# Altium project Mini-Stylophone.PrjPcb
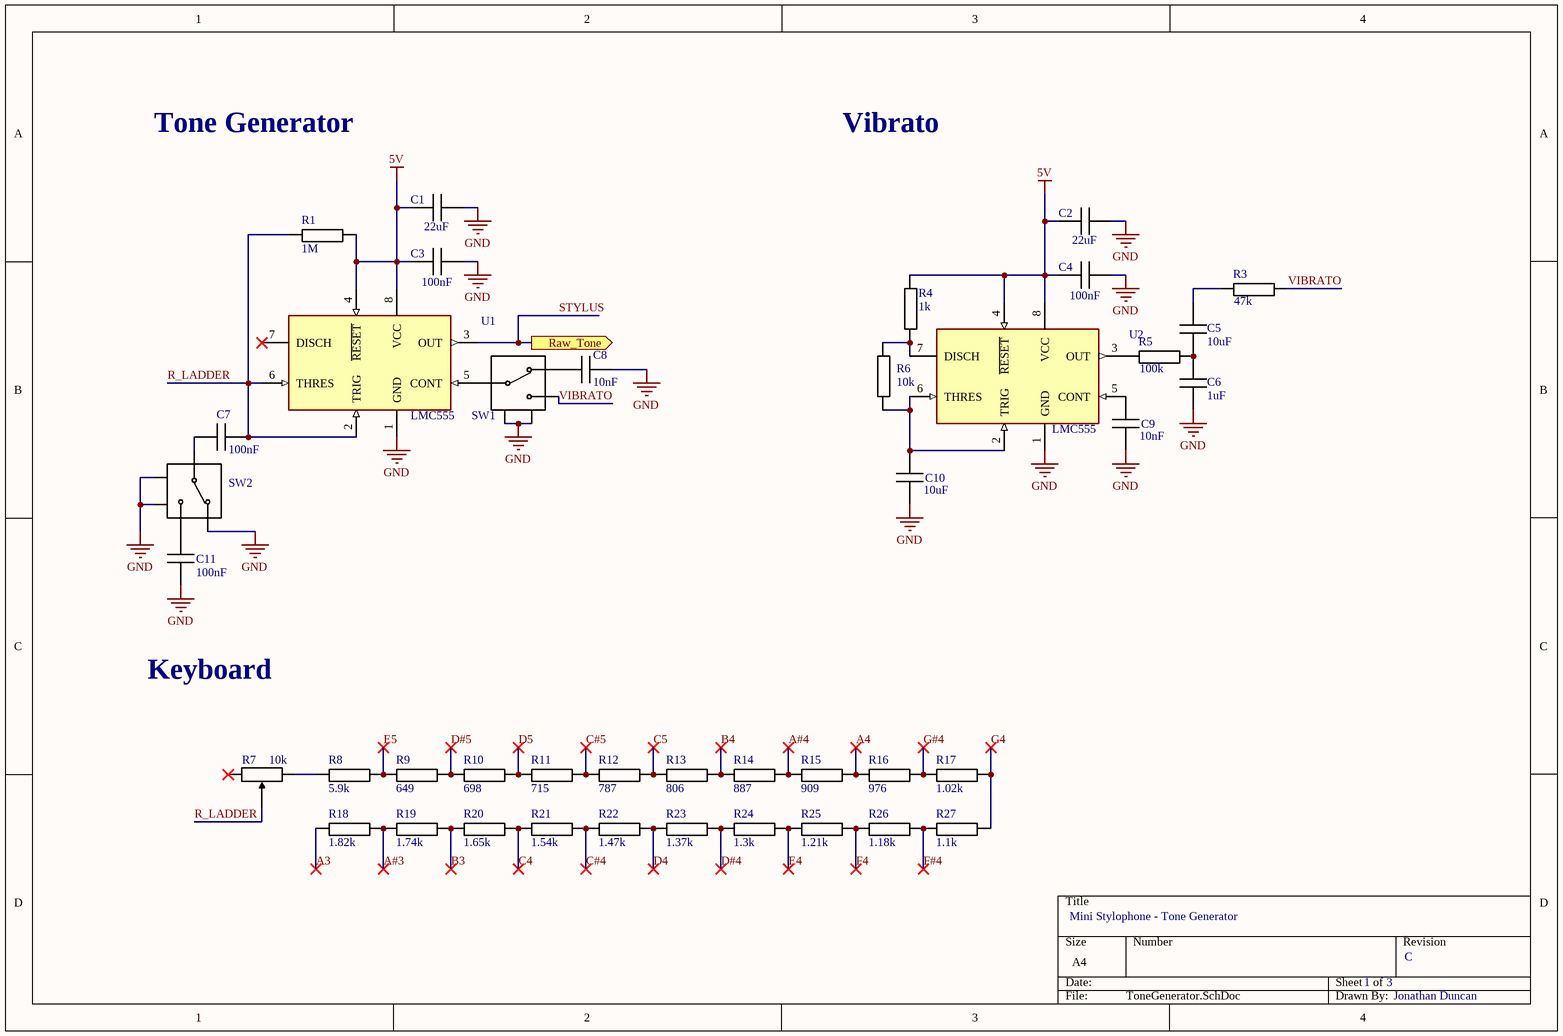
[diagram p0: ToneGenerator.SchDoc]
3 sheets, 82 parts. Net scope: flat (ports and power ports of the same name join across sheets).
Board file: StylophonePCB.PcbDoc
Sheets:
  ToneGenerator.SchDoc
  Amplifier.SchDoc
  Power.SchDoc

## Sheet ToneGenerator.SchDoc
size A4; SheetNumber: 1; SheetTotal: 2

### Parts
C1  value 22uF  [FP-CC0603-DA-IPC_B]  (hidden comment: Cap 22uF 0603)
C2  value 22uF  [FP-CC0603-DA-IPC_B]  (hidden comment: Cap 22uF 0603)
C3  value 100nF  [FP-CC0603-DA-IPC_B]  (hidden comment: Cap 100nF 0603)
C4  value 100nF  [FP-CC0603-DA-IPC_B]  (hidden comment: Cap 100nF 0603)
C5  value 10uF  [FP-CC0603-DA-IPC_B]  (hidden comment: Cap 10uF 0603)
C6  value 1uF  [FP-CC0603-DA-IPC_B]  (hidden comment: Cap 1uF 0603)
C7  value 100nF  [FP-CC0603-DA-IPC_B]  (hidden comment: Cap 100nF 0603)
C8  value 10nF  [FP-CC0603-DA-IPC_B]  (hidden comment: Cap 10nF 0603)
C9  value 10nF  [FP-CC0603-DA-IPC_B]  (hidden comment: Cap 10nF 0603)
C10  value 10uF  [FP-CC0603-DA-IPC_B]  (hidden comment: Cap 10uF 0603)
C11  value 100nF  [FP-CC0603-DA-IPC_B]  (hidden comment: Cap 100nF 0603)
R1  value 1M  [FP-RC0603-0_55-IPC_B]  (hidden comment: Res 1M 0603)
R3  value 47k  [FP-RC0603-0_55-IPC_B]  (hidden comment: Res 47k 0603)
R4  value 1k  [FP-RC0603-0_55-IPC_B]  (hidden comment: Res 1k 0603)
R5  value 100k  [FP-RC0603-0_55-IPC_B]  (hidden comment: Res 100k 0603)
R6  value 10k  [FP-RC0603-0_55-IPC_B]  (hidden comment: Res 10k 0603)
R7  value 10k  [BOUR-TC33X-2_V]  (hidden comment: TC33X-2-103E)
R8  value 5.9k  [FP-RC0603-0_55-IPC_B]  (hidden comment: Res 5k1 0603)
R9  value 649  [FP-RC0603-0_55-IPC_B]  (hidden comment: Res 620R 0603)
R10  value 698  [FP-RC0603-0_55-IPC_B]  (hidden comment: Res 680R 0603)
R11  value 715  [FP-RC0603-0_55-IPC_B]  (hidden comment: Res 750R 0603)
R12  value 787  [FP-RC0603-0_55-IPC_B]  (hidden comment: Res 750R 0603)
R13  value 806  [FP-RC0603-0_55-IPC_B]  (hidden comment: Res 820R 0603)
R14  value 887  [FP-RC0603-0_55-IPC_B]  (hidden comment: Res 910R 0603)
R15  value 909  [FP-RC0603-0_55-IPC_B]  (hidden comment: Res 910R 0603)
R16  value 976  [FP-RC0603-0_55-IPC_B]  (hidden comment: Res 1k 0603)
R17  value 1.02k  [FP-RC0603-0_55-IPC_B]  (hidden comment: Res 1k 0603)
R18  value 1.82k  [FP-RC0603-0_55-IPC_B]  (hidden comment: Res 1k8 0603)
R19  value 1.74k  [FP-RC0603-0_55-IPC_B]  (hidden comment: Res 1k8 0603)
R20  value 1.65k  [FP-RC0603-0_55-IPC_B]  (hidden comment: Res 1k6 0603)
R21  value 1.54k  [FP-RC0603-0_55-IPC_B]  (hidden comment: Res 1k5 0603)
R22  value 1.47k  [FP-RC0603-0_55-IPC_B]  (hidden comment: Res 1k5 0603)
R23  value 1.37k  [FP-RC0603-0_55-IPC_B]  (hidden comment: Res 1k3 0603)
R24  value 1.3k  [FP-RC0603-0_55-IPC_B]  (hidden comment: Res 1k3 0603)
R25  value 1.21k  [FP-RC0603-0_55-IPC_B]  (hidden comment: Res 1k3 0603)
R26  value 1.18k  [FP-RC0603-0_55-IPC_B]  (hidden comment: Res 1k1 0603)
R27  value 1.1k  [FP-RC0603-0_55-IPC_B]  (hidden comment: Res 1k1 0603)
SW1  SS12D07VG4 087  [SS12D07VG4 087-Footprint-1]  (value not drawn)
SW2  SS12D07VG4 087  [SS12D07VG4 087-Footprint-1]  (value not drawn)
U1  LMC555  [FP-D0008A-IPC_B]
U2  LMC555  [FP-D0008A-IPC_B]

### Ports
Raw_Tone (out, see Amplifier[1B])

### Nets
5V: C1.1 C2.1 C3.1 C4.1 R1.2 R4.2 U1.4(~{RESET}) U1.8(VCC) U2.4(~{RESET}) U2.8(VCC)
GND: C1.2 C2.2 C3.2 C4.2 C6.1 C8.1 C9.1 C10.1 C11.2 SW1.4 SW1.5 SW2.1 SW2.4 SW2.5 U1.1(GND) U2.1(GND)
A3: R18.1
A4: R15.2 R16.1
A#3: R18.2 R19.1
A#4: R14.2 R15.1
B3: R19.2 R20.1
B4: R13.2 R14.1
C4: R20.2 R21.1
C5: R12.2 R13.1
C#4: R21.2 R22.1
C#5: R11.2 R12.1
D4: R22.2 R23.1
D5: R10.2 R11.1
D#4: R23.2 R24.1
D#5: R9.2 R10.1
E4: R24.2 R25.1
E5: R8.2 R9.1
F4: R25.2 R26.1
F#4: R26.2 R27.1
G4: R17.2 R27.2
G#4: R16.2 R17.1
R_LADDER: C7.1 R1.1 R7.2 U1.2(TRIG) U1.6(THRES)
STYLUS: U1.3(OUT) ; port Raw_Tone
VIBRATO: R3.2 SW1.3
NetC5_1: C5.1 C6.2 R5.2
NetC5_2: C5.2 R3.1
NetC7_2: C7.2 SW2.2
NetC8_2: C8.2 SW1.1
NetC9_2: C9.2 U2.5(CONT)
NetC10_2: C10.2 R6.1 U2.2(TRIG) U2.6(THRES)
NetC11_1: C11.1 SW2.3
NetR4_1: R4.1 R6.2 U2.7(DISCH)
NetR5_1: R5.1 U2.3(OUT)
NetR7_3: R7.3 R8.1
NetSW1_2: SW1.2 U1.5(CONT)

Not connected (* = marked no-connect by the designer): R7 1*; U1 7(DISCH)*

### Notes on the sheet
- Tone Generator
- Vibrato
- Keyboard
- Mini Stylophone - Tone Generator
- 1
- 3
- C
- Jonathan Duncan

### Library data of the parts
C1 C2 = CMP-001-00003-1: 22uF 6.3V 20% X5R 0603 SMD Capacitor; Case/Package: 0603; Mounting Technology: SMT; Voltage Rating: 6.3V; Tolerance: 20%; Temperature Coefficient: X5R
C3 C4 C7 C11 = CMP-00006-5: 100nF 50V 10% X7R 0603 SMD Capacitor Decoupling; Temperature Coefficient: X7R; Mounting Technology: SMT; Tolerance: 10%; Case/Package: 0603; Voltage Rating: 50V
C5 C10 = CMP-001-00002-1: 10uF 6.3V 10% X5R 0603 SMD Capacitor; Mounting Technology: SMT; Voltage Rating: 6.3V; Case/Package: 0603; Tolerance: 10%; Temperature Coefficient: X5R
C6 = CMP-001-00001-2: 1uF 25V 10% X5R 0603 SMD Capacitor; Temperature Coefficient: X5R; Case/Package: 0603; Voltage Rating: 25V; Tolerance: 10%; Mounting Technology: SMT
C8 C9 = CMP-001-00000-5: 10nF 50V 10% X7R 0603 SMD Capacitor; Case/Package: 0603; Tolerance: 10%; Temperature Coefficient: X7R; Voltage Rating: 50V; Mounting Technology: SMT
R1 = CMP-009-00021-1: 1M 1% 100mW 0603 SMD Resistor; Case/Package: 0603; Tolerance: 1%; Mounting Technology: SMT; Power Rating: 100mW
R3 = CMP-009-00004-1: 47k 1% 100mW 0603 SMD Resistor; Tolerance: 1%; Case/Package: 0603; Mounting Technology: SMT; Power Rating: 100mW
R4 R16 R17 = CMP-00011-1: 1k 1% 100mW 0603 SMD Resistor; Tolerance: 1%; Case/Package: 0603; Mounting Technology: SMT; Power Rating: 100mW
R5 = CMP-009-00003-1: 100k 1% 100mW 0603 SMD Resistor; Power Rating: 100mW; Case/Package: 0603; Mounting Technology: SMT; Tolerance: 1%
R6 = CMP-009-00000-1: 10k 1% 100mW 0603 SMD Resistor; Case/Package: 0603; Power Rating: 100mW; Mounting Technology: SMT; Tolerance: 1%
R7 = CMP-00022-2: SMD 3mm Cermet Trimmer - Leadfree 3MM 10KOHMS 25% 0.1WATT OPEN FRM; Mounting Technology: SMT
R8 = CMP-009-00005-1: 5.1k 1% 100mW 0603 SMD Resistor; Power Rating: 100mW; Mounting Technology: SMT; Tolerance: 1%; Case/Package: 0603
R9 = CMP-009-00006-1: 620R 1% 100mW 0603 SMD Resistor; Tolerance: 1%; Mounting Technology: SMT; Power Rating: 100mW; Case/Package: 0603
R10 = CMP-009-00015-1: 680R 1% 100mW 0603 SMD Resistor; Mounting Technology: SMT; Power Rating: 100mW; Tolerance: 1%; Case/Package: 0603
R11 R12 = CMP-009-00007-2: 750R 1% 100mW 0603 SMD Resistor; Tolerance: 1%; Case/Package: 0603; Mounting Technology: SMT; Power Rating: 100mW
R13 = CMP-009-00008-1: 820R 1% 100mW 0603 SMD Resistor; Case/Package: 0603; Mounting Technology: SMT; Tolerance: 1%; Power Rating: 100mW
R14 R15 = CMP-009-00009-1: 910R 1% 100mW 0603 SMD Resistor; Case/Package: 0603; Mounting Technology: SMT; Tolerance: 1%; Power Rating: 100mW
R18 R19 = CMP-009-00014-1: 1.8k 1% 100mW 0603 SMD Resistor; Case/Package: 0603; Mounting Technology: SMT; Tolerance: 1%; Power Rating: 100mW
R20 = CMP-009-00013-1: 1.6k 1% 100mW 0603 SMD Resistor; Mounting Technology: SMT; Tolerance: 1%; Case/Package: 0603; Power Rating: 100mW
R21 R22 = CMP-009-00012-1: 1.5k 1% 100mW 0603 SMD Resistor; Power Rating: 100mW; Tolerance: 1%; Mounting Technology: SMT; Case/Package: 0603
R23-R25 = CMP-009-00011-2: 1.3k 1% 100mW 0603 SMD Resistor; Tolerance: 1%; Case/Package: 0603; Mounting Technology: SMT; Power Rating: 100mW
R26 R27 = CMP-009-00010-1: 1.1k 1% 100mW 0603 SMD Resistor; Power Rating: 100mW; Tolerance: 1%; Case/Package: 0603; Mounting Technology: SMT
SW1 SW2 = CMP-002-000001-2: Direct Insert 500mA Single Pole Double Throw (SPDT) 50V 5 Thousand Times Plugin Slide Switches ROHS
U1 U2 = CMP-001-0000-1: Single Precision Timer 8-SOIC 0 to 70; Max Supply Voltage: 15V; Min Supply Voltage: 1.5V; Pins: 8; Case/Package: SOIC; Mounting Technology: SMT

## Sheet Amplifier.SchDoc
size A4; SheetNumber: 2; SheetTotal: 2
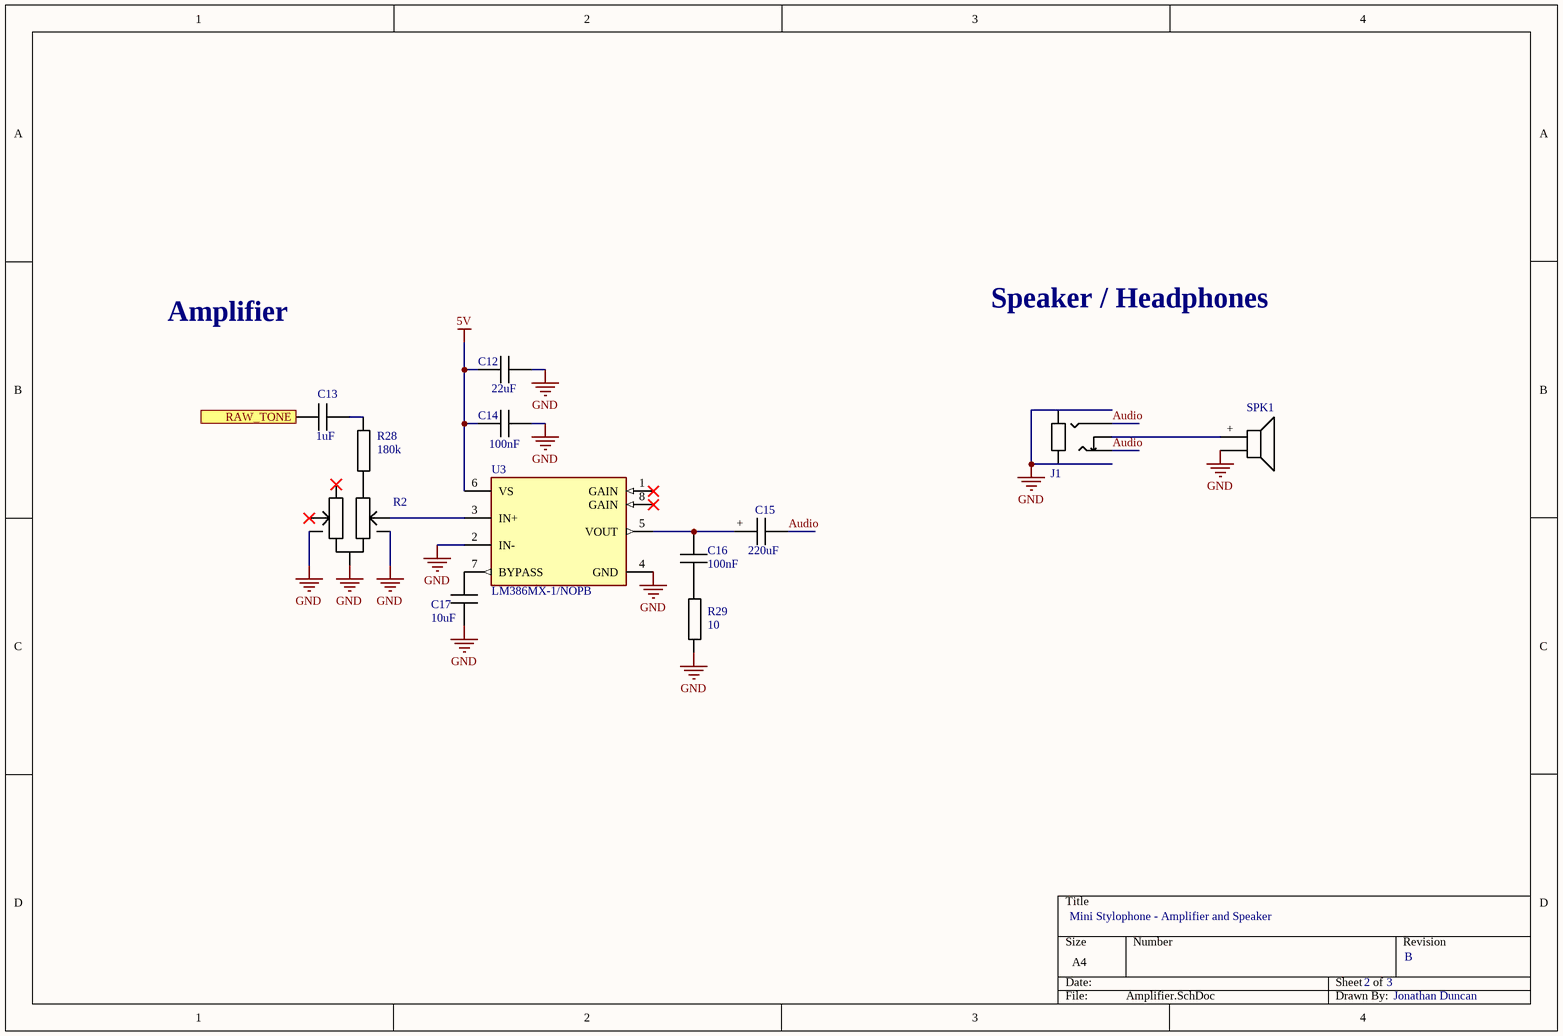
[diagram p1: Amplifier.SchDoc]

### Parts
C12  value 22uF  [FP-CC0603-DA-IPC_B]  (hidden comment: Cap 22uF 0603)
C13  value 1uF  [FP-CC0603-DA-IPC_B]  (hidden comment: Cap 1uF 0603)
C14  value 100nF  [FP-CC0603-DA-IPC_B]  (hidden comment: Cap 100nF 0603)
C15  value 220uF  [VT1C221M0607-Footprint-1]  (hidden comment: VT1C221M0607)
C16  value 100nF  [FP-CC0603-DA-IPC_B]  (hidden comment: Cap 100nF 0603)
C17  value 10uF  [FP-CC0603-DA-IPC_B]  (hidden comment: Cap 10uF 0603)
J1  PJ-327A 5JJ  [PJ-327A 5JJ-Footprint-1]  (value not drawn)
R2  RK10J12R0A0B  [RK10J12R0A0B-Footprint-1]  (value not drawn)
R28  value 180k  [FP-RC0603-0_55-IPC_B]  (hidden comment: Res 180k 0603)
R29  value 10  [FP-RC0603-0_55-IPC_B]  (hidden comment: Res 10R 0603)
SPK1  GSPK2307P-8R1W  [GSPK2307P-8R1W-Footprint-1]  (value not drawn)
U3  LM386MX-1/NOPB  [FP-D0008A-IPC_B]

### Ports
RAW_TONE (in, see ToneGenerator[2B])

### Nets
5V: C12.1 C14.1 U3.6(VS)
GND: C12.2 C14.2 C17.1 J1.1 J1.2 R2.1 R2.6 R2.7 R29.1 SPK1.- U3.2(IN-) U3.4(GND)
Audio: C15.- J1.3 J1.4
STYLUS: C13.1 ; port RAW_TONE
NetC13_2: C13.2 R28.2
NetC15_+: C15.+ C16.1 U3.5(VOUT)
NetC16_2: C16.2 R29.2
NetC17_2: C17.2 U3.7(BYPASS)
NetJ1_5: J1.5 SPK1.+
NetR2_4: R2.4 U3.3(IN+)
NetR2_5: R2.5 R28.1

Not connected (* = marked no-connect by the designer): R2 2* 3*; U3 1(GAIN)* 8(GAIN)*

### Notes on the sheet
- Speaker / Headphones
- Amplifier
- Mini Stylophone - Amplifier and Speaker
- 2
- 3
- B
- Jonathan Duncan

### Library data of the parts
C12 = CMP-001-00003-1: 22uF 6.3V 20% X5R 0603 SMD Capacitor; Case/Package: 0603; Mounting Technology: SMT; Voltage Rating: 6.3V; Tolerance: 20%; Temperature Coefficient: X5R
C13 = CMP-001-00001-2: 1uF 25V 10% X5R 0603 SMD Capacitor; Temperature Coefficient: X5R; Case/Package: 0603; Voltage Rating: 25V; Tolerance: 10%; Mounting Technology: SMT
C14 C16 = CMP-00006-5: as C3 on sheet ToneGenerator; Temperature Coefficient: X7R; Mounting Technology: SMT; Tolerance: 10%; Case/Package: 0603; Voltage Rating: 50V
C15 = CMP-00005-2: SMD Aluminum Electrolytic Capacitor SMD, D6.3xL7.7mm 220µF ±20% 16V 2000Hrs@105℃ 110mA@120Hz; Height: 7.7mm; Mounting Technology: SMT; Diameter: 6.3mm; Voltage Rating: 16V; Tolerance: 20%
C17 = CMP-001-00002-1: 10uF 6.3V 10% X5R 0603 SMD Capacitor; Mounting Technology: SMT; Voltage Rating: 6.3V; Case/Package: 0603; Tolerance: 10%; Temperature Coefficient: X5R
J1 = CMP-00021-1: -30℃~+70℃ 3.5mm Headphone Jack 30V 500mA SMD Audio Connectors (Headphones) ROHS
R2 = CMP-00023-1: ±30% 10kΩ SMD-5P, 14x2.5mm Potentiometers, Variable Resistors ROHS
R28 = CMP-009-00001-1: 180k 1% 100mW 0603 SMD Resistor; Mounting Technology: SMT; Power Rating: 100mW; Case/Package: 0603; Tolerance: 1%
R29 = CMP-009-00002-1: 10R 1% 100mW 0603 SMD Resistor; Tolerance: 1%; Case/Package: 0603; Power Rating: 100mW; Mounting Technology: SMT
SPK1 = CMP-00000-7: 5% 8R Electromagnetic Speaker 1.7kHz 88dB 500mW 23mm; Impedance: 8R; Diameter: 23mm; Mounting Technology: THT; Power Rating: 500mW
U3 = CMP-00004-1: 700-mW, mono, 5- to 18-V, analog input Class-AB audio amplifier 8-SOIC 0 to 70; Max Supply Voltage: 12V; Min Supply Voltage: 4V; Case/Package: SOIC; Pins: 8; Mounting Technology: SMT

## Sheet Power.SchDoc
size A4; SheetNumber: 3; SheetTotal: 3
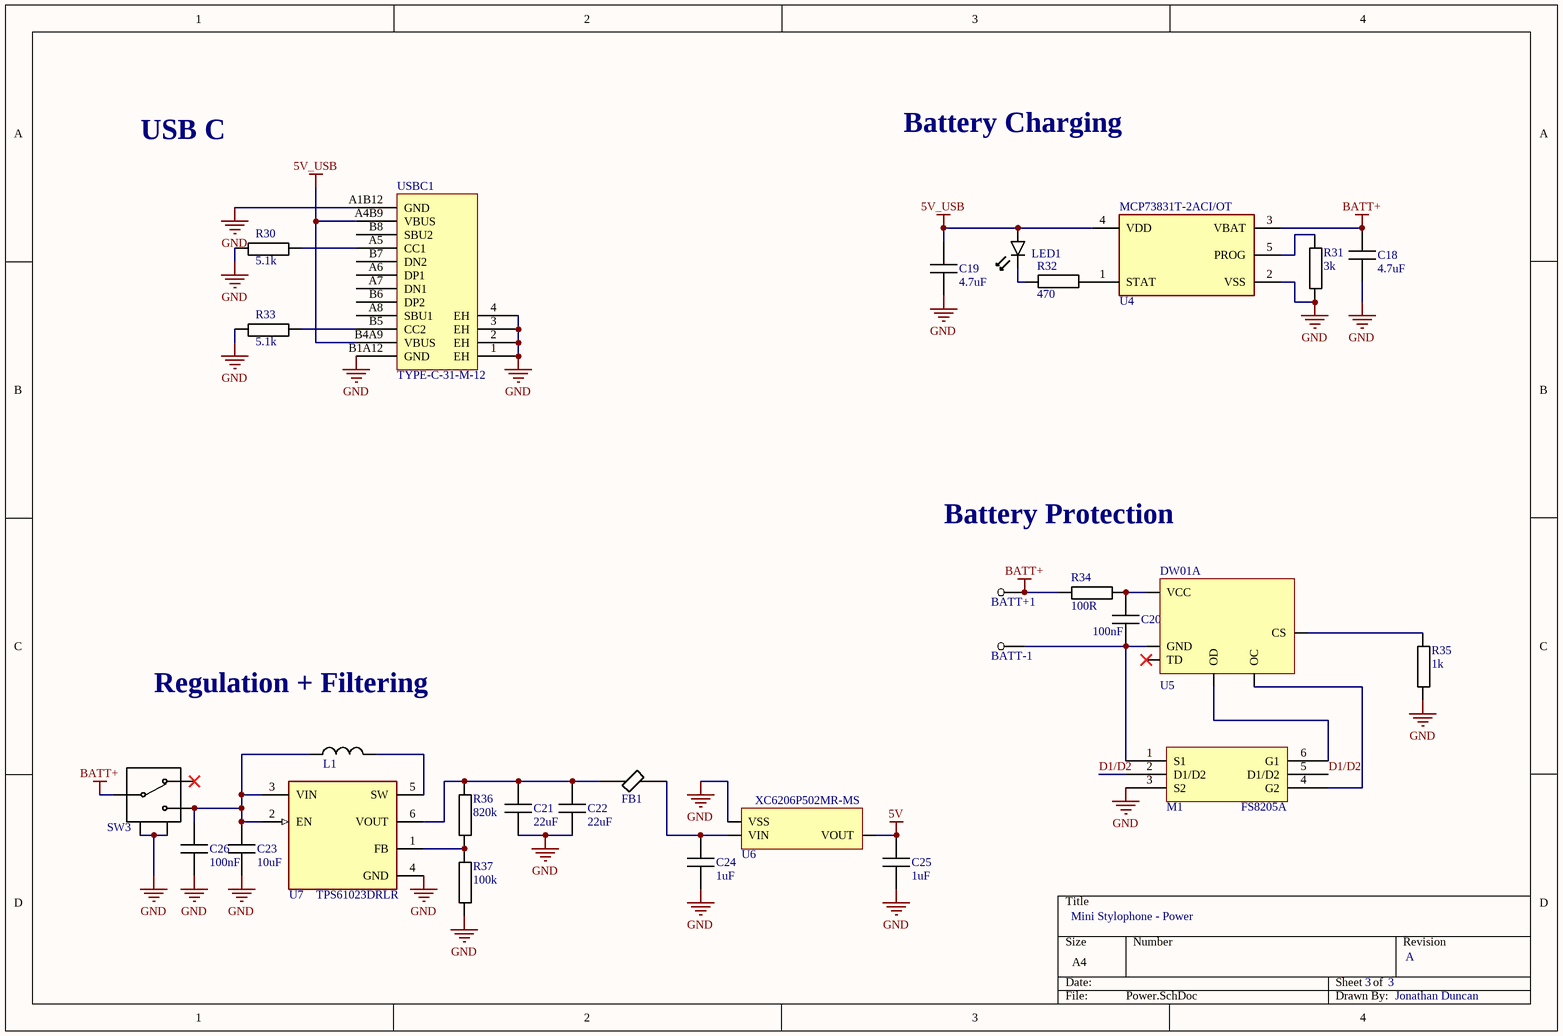
[diagram p2: Power.SchDoc]

### Parts
BATT+1  THT 100mil pad  [THT 100mil pad-Footprint-1]  (value not drawn)  (no BOM)
BATT-1  THT 100mil pad  [THT 100mil pad-Footprint-1]  (value not drawn)  (no BOM)
C18  value 4.7uF  [FP-CC0603-DA-IPC_B]  (hidden comment: Cap 4.7uF 0603)
C19  value 4.7uF  [FP-CC0603-DA-IPC_B]  (hidden comment: Cap 4.7uF 0603)
C20  value 100nF  [FP-CC0603-DA-IPC_B]  (hidden comment: Cap 100nF 0603)
C21  value 22uF  [FP-CC0603-DA-IPC_B]  (hidden comment: Cap 22uF 0603)
C22  value 22uF  [FP-CC0603-DA-IPC_B]  (hidden comment: Cap 22uF 0603)
C23  value 10uF  [FP-CC0603-DA-IPC_B]  (hidden comment: Cap 10uF 0603)
C24  value 1uF  [FP-CC0603-DA-IPC_B]  (hidden comment: Cap 1uF 0603)
C25  value 1uF  [FP-CC0603-DA-IPC_B]  (hidden comment: Cap 1uF 0603)
C26  value 100nF  [FP-CC0603-DA-IPC_B]  (hidden comment: Cap 100nF 0603)
FB1  BLM21AG601SN1D  [FP-BLM21-0_2-t0_85-e0_5-IPC_B]  (value not drawn)
L1  FWP252012P-1R0ML  [INDC2520X120N]  (value not drawn)
LED1  XL-1608SURC-06  [DIOC1608X60N]  (value not drawn)
M1  FS8205A  [SOT95P280X125-6N]
R30  value 5.1k  [FP-RC0603-0_55-IPC_B]  (hidden comment: Res 5k1 0603)
R31  value 3k  [FP-RC0603-0_55-IPC_B]  (hidden comment: Res 3k 0603)
R32  value 470  [FP-RC0603-0_55-IPC_B]  (hidden comment: Res 470 0603)
R33  value 5.1k  [FP-RC0603-0_55-IPC_B]  (hidden comment: Res 5k1 0603)
R34  value 100R  [FP-RC0603-0_55-IPC_B]  (hidden comment: Res 100R 0603)
R35  value 1k  [FP-RC0603-0_55-IPC_B]  (hidden comment: Res 1k 0603)
R36  value 820k  [FP-RC0603-0_55-IPC_B]  (hidden comment: Res 820k 0603)
R37  value 100k  [FP-RC0603-0_55-IPC_B]  (hidden comment: Res 100k 0603)
SW3  SS12D07VG4 087  [SS12D07VG4 087-Footprint-1]  (value not drawn)
U4  MCP73831T-2ACI/OT  [FP-C04-091-OT-IPC_B]
U5  DW01A  [SOT95P280X120-6N]
U6  XC6206P502MR-MS  [SOT95P240X115-3N]
U7  TPS61023DRLR  [FP-DRL0006A-MFG]
USBC1  TYPE-C-31-M-12  [TYPE-C-31-M-12-Footprint-1]

### Nets
5V: C25.2 U6.3(VOUT)
5V_USB: C19.2 LED1.2 U4.4(VDD) USBC1.A4B9(VBUS) USBC1.B4A9(VBUS)
BATT+: BATT+1.1 C18.2 R34.1 SW3.2 U4.3(VBAT)
GND: C18.1 C19.1 C21.1 C22.1 C23.1 C24.1 C25.1 C26.1 M1.3(S2) R30.1 R31.1 R33.1 R35.1 R37.1 SW3.4 SW3.5 U4.2(VSS) U6.1(VSS) U7.4(GND) USBC1.1(EH) USBC1.2(EH) USBC1.3(EH) USBC1.4(EH) USBC1.A1B12(GND) USBC1.B1A12(GND)
D1/D2: M1.2(D1/D2) M1.5(D1/D2)
NetBATT-1_1: BATT-1.1 C20.1 M1.1(S1) U5.6(GND)
NetC20_2: C20.2 R34.2 U5.5(VCC)
NetC21_2: C21.2 C22.2 FB1.1 R36.2 U7.6(VOUT)
NetC23_2: C23.2 C26.2 L1.1 SW3.3 U7.2(EN) U7.3(VIN)
NetC24_2: C24.2 FB1.2 U6.2(VIN)
NetL1_2: L1.2 U7.5(SW)
NetLED1_1: LED1.1 R32.2
NetM1_4: M1.4(G2) U5.3(OC)
NetM1_6: M1.6(G1) U5.1(OD)
NetR30_2: R30.2 USBC1.A5(CC1)
NetR31_2: R31.2 U4.5(PROG)
NetR32_1: R32.1 U4.1(STAT)
NetR33_2: R33.2 USBC1.B5(CC2)
NetR35_2: R35.2 U5.2(CS)
NetR36_1: R36.1 R37.2 U7.1(FB)

Not connected (* = marked no-connect by the designer): SW3 1*; U5 4(TD)*; USBC1 A6(DP1) A7(DN1) A8(SBU1) B6(DP2) B7(DN2) B8(SBU2)

### Notes on the sheet
- USB C
- Battery Charging
- Battery Protection
- Regulation + Filtering
- Mini Stylophone - Power
- 3
- A
- Jonathan Duncan

### Library data of the parts
BATT+1 BATT-1 = CMP-00020-1: 40mil hole, 100mil pad THT; Hole Diameter: 40mil; Pad Diameter: 100mil
C18 C19 = CMP-001-00004-1: 4.7uF 16V 10% X5R 0603 SMD Capacitor; Voltage Rating: 16V; Tolerance: 10%; Temperature Coefficient: X5R; Mounting Technology: SMT; Case/Package: 0603
C20 C26 = CMP-00006-5: as C3 on sheet ToneGenerator; Temperature Coefficient: X7R; Mounting Technology: SMT; Tolerance: 10%; Case/Package: 0603; Voltage Rating: 50V
C21 C22 = CMP-001-00003-1: 22uF 6.3V 20% X5R 0603 SMD Capacitor; Case/Package: 0603; Mounting Technology: SMT; Voltage Rating: 6.3V; Tolerance: 20%; Temperature Coefficient: X5R
C23 = CMP-001-00002-1: 10uF 6.3V 10% X5R 0603 SMD Capacitor; Mounting Technology: SMT; Voltage Rating: 6.3V; Case/Package: 0603; Tolerance: 10%; Temperature Coefficient: X5R
C24 C25 = CMP-001-00001-2: 1uF 25V 10% X5R 0603 SMD Capacitor; Temperature Coefficient: X5R; Case/Package: 0603; Voltage Rating: 25V; Tolerance: 10%; Mounting Technology: SMT
FB1 = CMP-00030-2: Ferrite Beads Multi-Layer 600Ohm 25% 100MHz 600mA 210mOhm DCR 0805 T/R; Impedance: 600Ω; Case/Package: 0805; Case Code (Imperial): 0805
L1 = CMP-00031-3: 1MHz ¡À20% 41m¦¸ 3.5A 1¦ÌH 1008 2.5mm(Length)*1.2mm(height)
LED1 = CMP-00029-2: 120¡ã 330mcd 1.6*0.8*0.6 mm colourless£¬red£¬transparent 0603
M1 = CMP-00026-3: 1.5W 10V 1.2V 5.7NC@ 10V 1INDIVIDUALNCHANNEL 20V 19.5M¦¸@ 4.5V, 3A 6A 466PF@10V SOT-23-6
R30 R33 = CMP-009-00005-1: 5.1k 1% 100mW 0603 SMD Resistor; Power Rating: 100mW; Mounting Technology: SMT; Tolerance: 1%; Case/Package: 0603
R31 = CMP-009-00025-1: 3k 1% 100mW 0603 SMD Resistor; Tolerance: 1%; Mounting Technology: SMT; Power Rating: 100mW; Case/Package: 0603
R32 = CMP-00011-2: 470 1% 100mW 0603 SMD Resistor; Case/Package: 0603; Power Rating: 100mW; Tolerance: 1%; Mounting Technology: SMT
R34 = CMP-009-00020-1: 100R 1% 100mW 0603 SMD Resistor; Case/Package: 0603; Tolerance: 1%; Mounting Technology: SMT; Power Rating: 100mW
R35 = CMP-009-00023-1: 1k 1% 100mW 0603 SMD Resistor; Tolerance: 1%; Power Rating: 100mW; Mounting Technology: SMT; Case/Package: 0603
R36 = CMP-009-00024-1: 820k 1% 100mW 0603 SMD Resistor; Case/Package: 0603; Tolerance: 1%; Power Rating: 100mW; Mounting Technology: SMT
R37 = CMP-009-00003-1: 100k 1% 100mW 0603 SMD Resistor; Power Rating: 100mW; Case/Package: 0603; Mounting Technology: SMT; Tolerance: 1%
SW3 = CMP-002-000001-2: as SW1 on sheet ToneGenerator
U4 = CMP-00024-2: MCP73831 Series Single-Cell Li-Ion/Li-Polymer Battery Charge Controller SOT-23-5; Case/Package: SOT-23
U5 = CMP-00025-3: Battery management
U6 = CMP-00028-1: SOT-23, : : : 8V : 5.0V : 250mA (PSRR): 40dB@(1kHz), 2.5%, (IoT).
U7 = CMP-00027-1: Switching Voltage Regulators 3.7-A boost converter with 0.5-V ultra-low input vo
USBC1 = CMP-00002-5: USB Type-C Connector Female SMD 16 pin; Current Rating: 5A; Gender: Female; Mounting Technology: SMT

## Nets that join several sheets
5V: ToneGenerator (10 pins), Amplifier (C12.1 C14.1 U3.6), Power (C25.2 U6.3)
GND: ToneGenerator (16 pins), Amplifier (12 pins), Power (25 pins)
STYLUS: ToneGenerator (U1.3), Amplifier (C13.1)